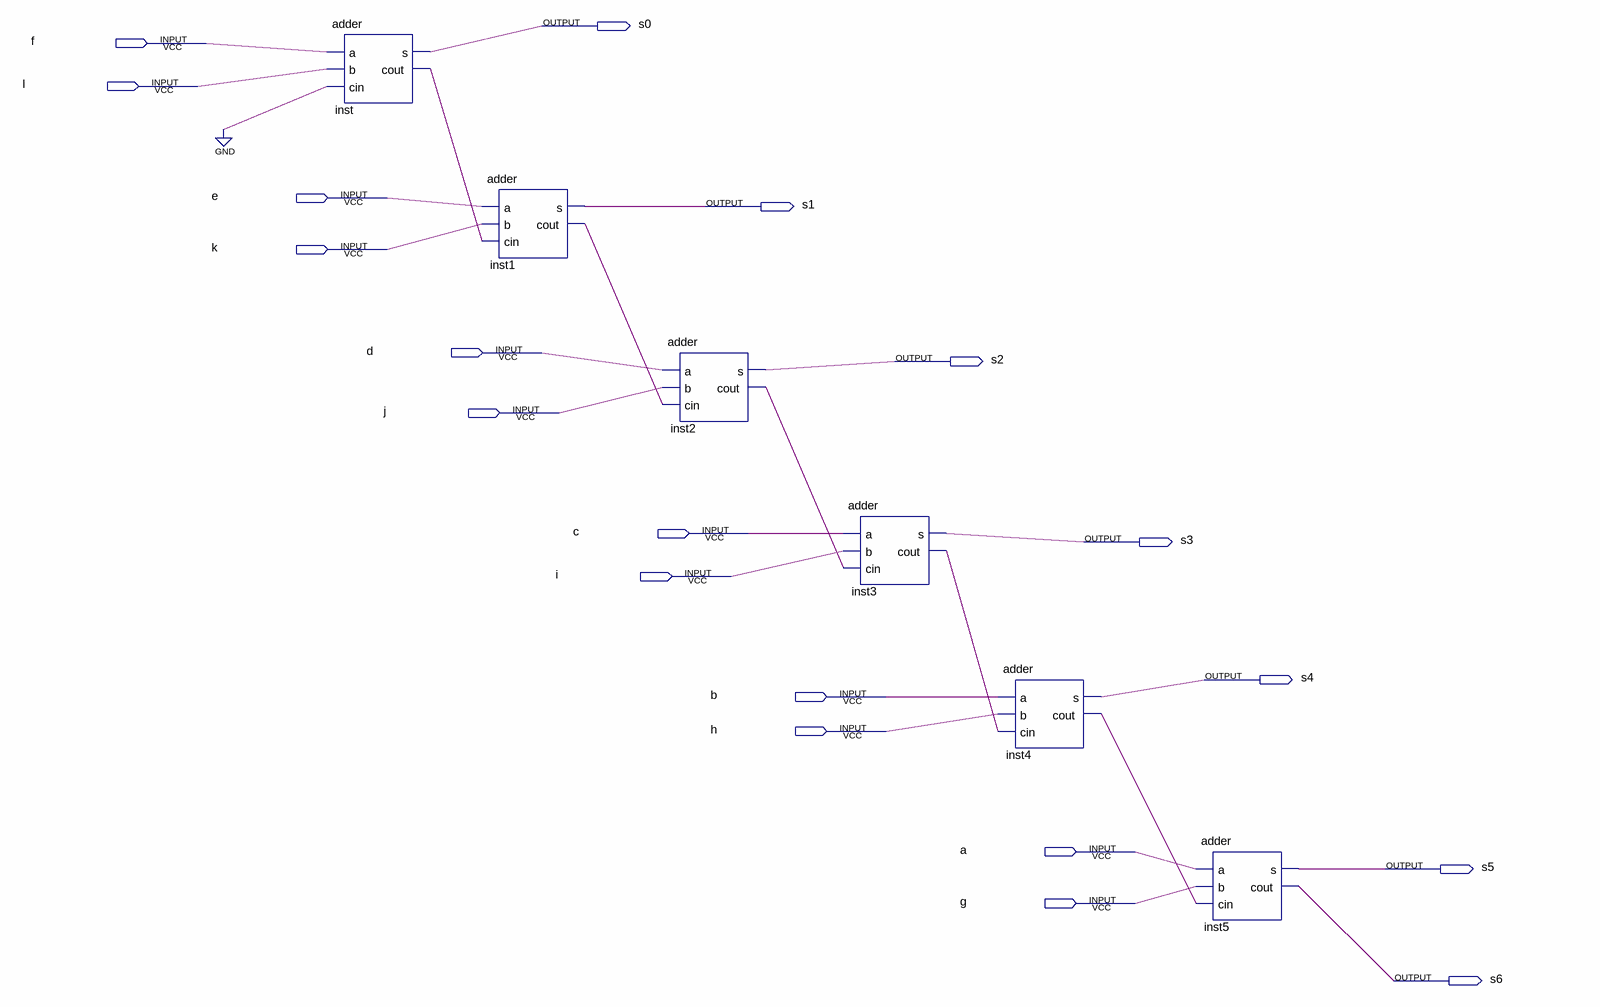
[diagram p0: schematic sheet]
// Quartus schematic adder6bits.bdf as structural Verilog: 6 symbols, 19 pins
module adder6bits (
  input  f,
  input  l,
  input  e,
  input  k,
  input  d,
  input  j,
  input  c,
  input  i,
  input  b,
  input  h,
  input  a,
  input  g,
  output s0,
  output s1,
  output s2,
  output s3,
  output s4,
  output s5,
  output s6
);

  wire inst1_cout, inst2_cout, inst3_cout, inst4_cout, inst_cout;

  adder inst (.a(f), .b(l), .cin(1'b0), .s(s0), .cout(inst_cout));
  adder inst1 (.a(e), .b(k), .cin(inst_cout), .s(s1), .cout(inst1_cout));
  adder inst2 (.a(d), .b(j), .cin(inst1_cout), .s(s2), .cout(inst2_cout));
  adder inst3 (.a(c), .b(i), .cin(inst2_cout), .s(s3), .cout(inst3_cout));
  adder inst4 (.a(b), .b(h), .cin(inst3_cout), .s(s4), .cout(inst4_cout));
  adder inst5 (.a(a), .b(g), .cin(inst4_cout), .s(s5), .cout(s6));
endmodule
